# Altium schematic sheet ESP32_Sheet.SchDoc (part 1 of 3)
size 420 x 297 mm; SheetNumber: 3; SheetTotal: 15
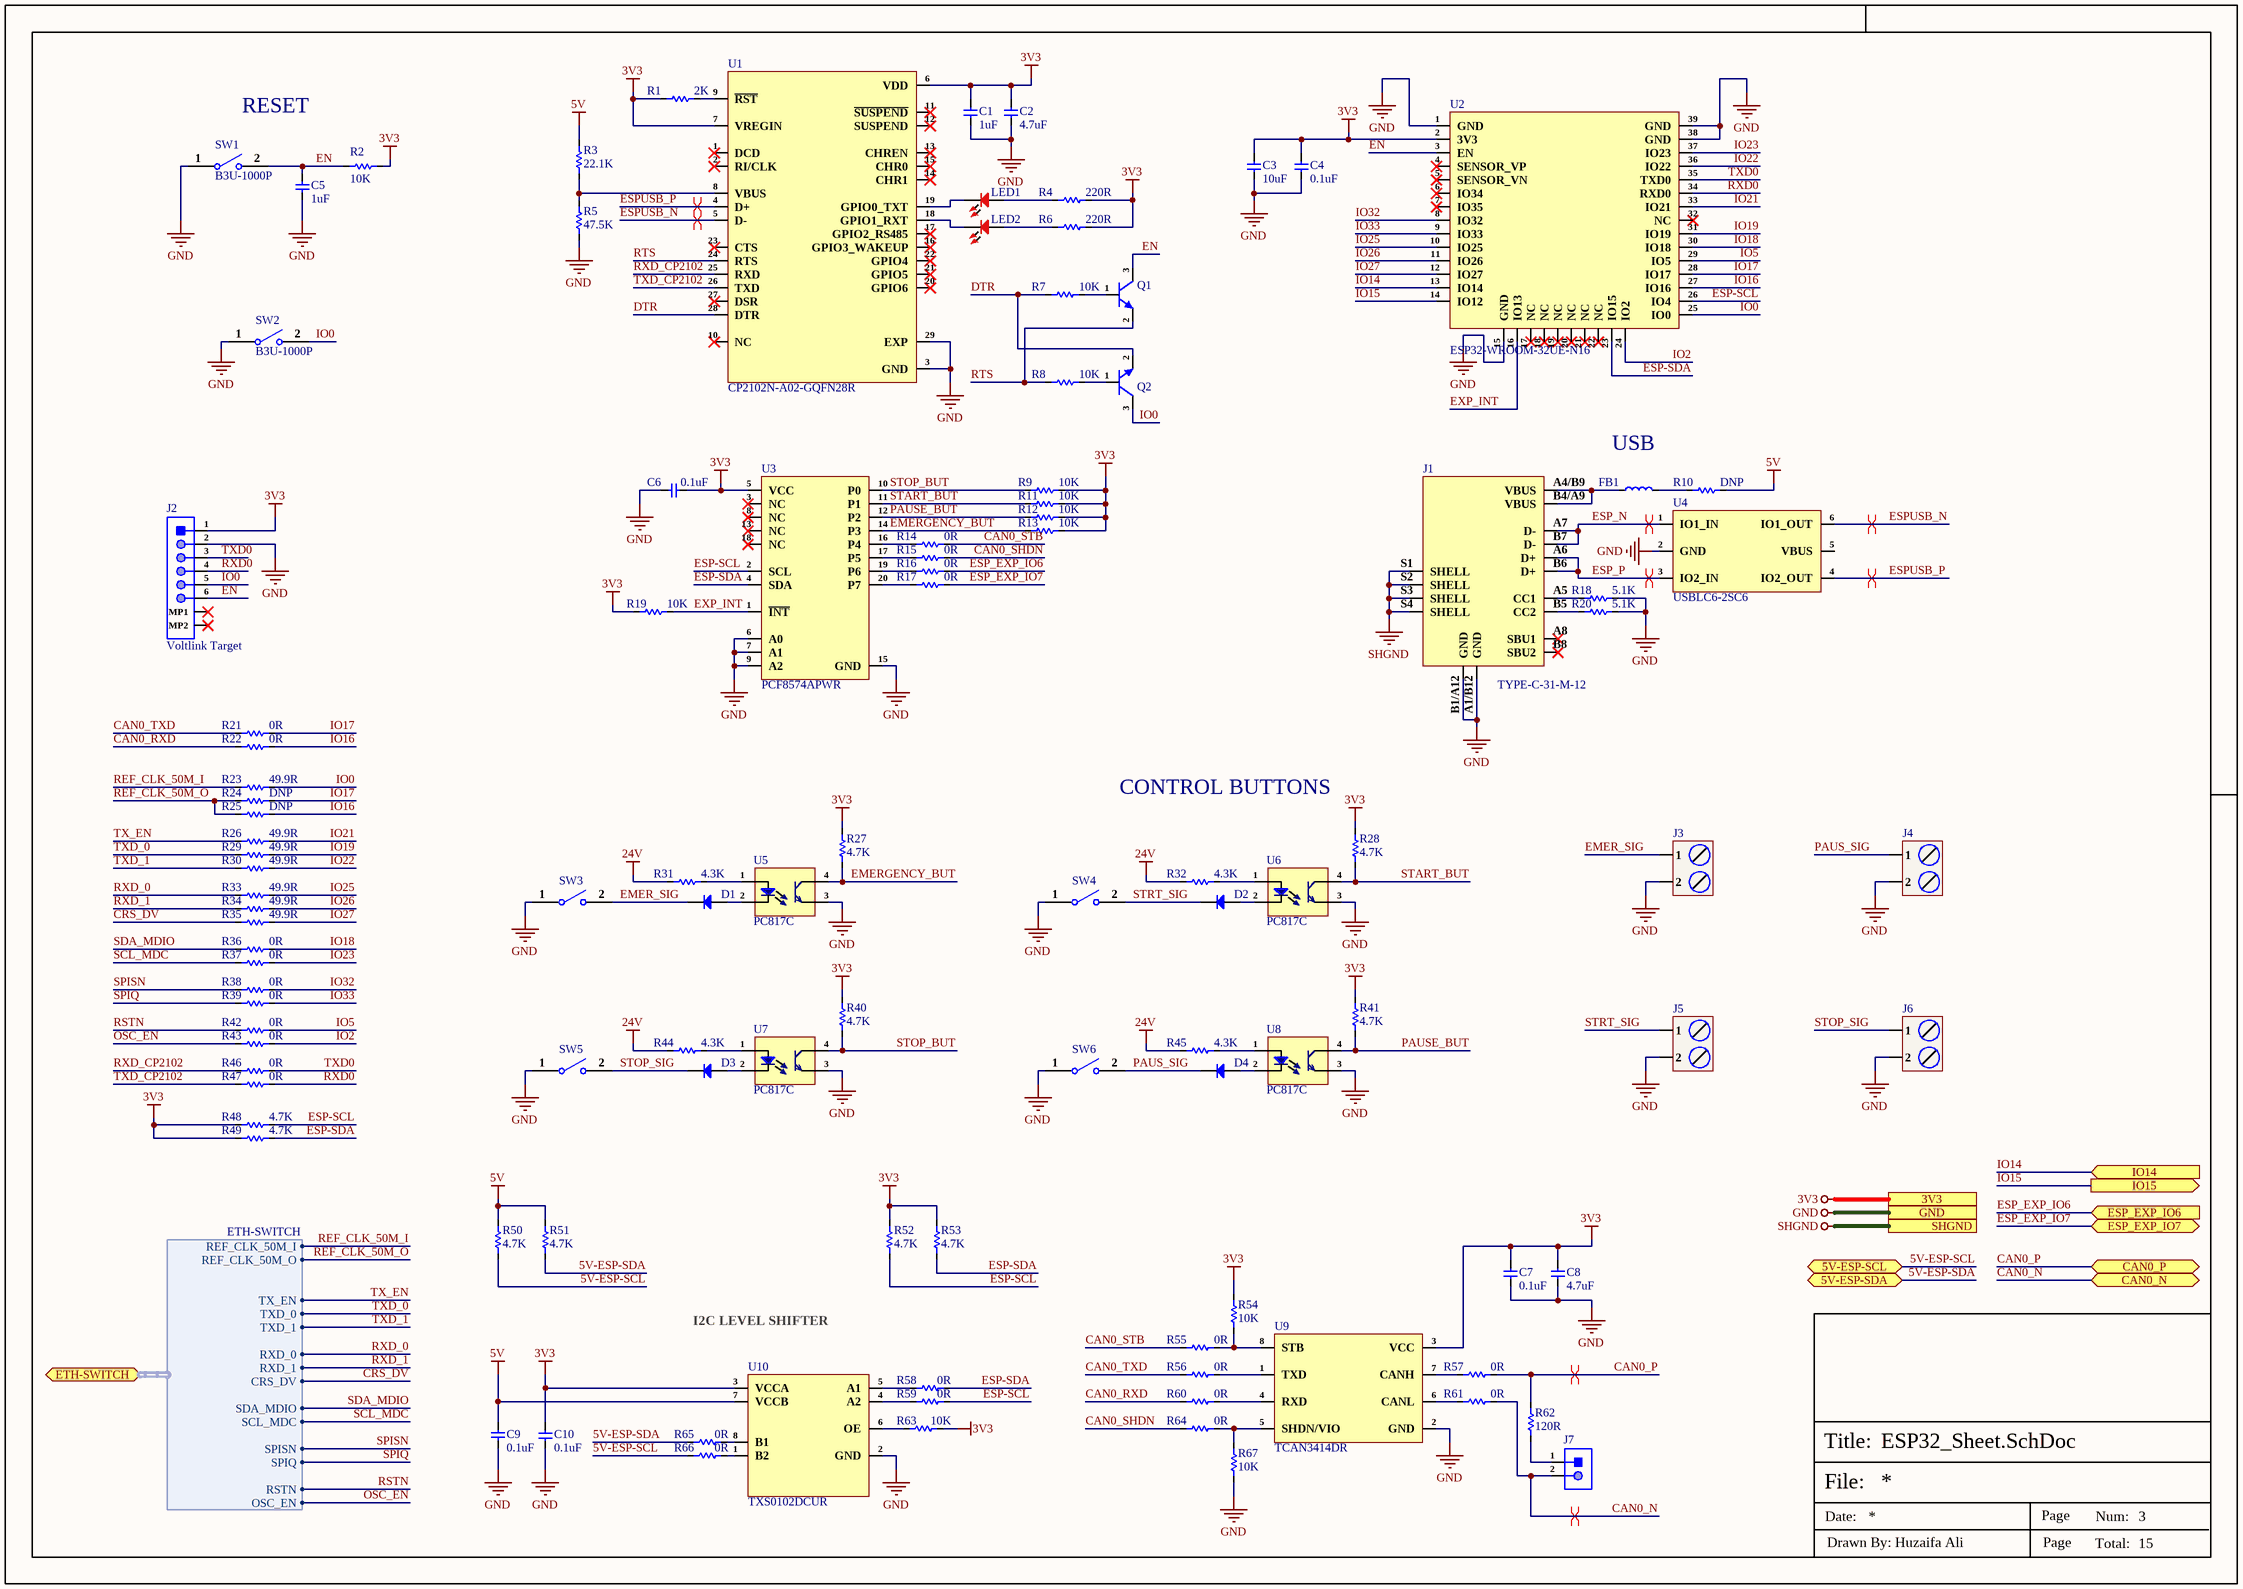
[diagram p0: ESP32_Sheet.SchDoc]

## Parts
C1  1uF  [Cap-0402]
C2  4.7uF  [Cap-0805]
C3  10uF  [Cap-0603]
C4  0.1uF  [Cap-0402]
C5  1uF  [Cap-0402]
C6  0.1uF  [Cap-0402]
C7  0.1uF  [Cap-0402]
C8  4.7uF  [Cap-0402]
C9  0.1uF  [Cap-0402]
C10  0.1uF  [Cap-0402]
D1  1N4148W-7-F  [SOD-123]  (value not drawn)
D2  1N4148W-7-F  [SOD-123]  (value not drawn)
D3  1N4148W-7-F  [SOD-123]  (value not drawn)
D4  1N4148W-7-F  [SOD-123]  (value not drawn)
FB1  BLM18PG221SN1D  [IND-0603 (1608 Metric)]  (value not drawn)
J1  TYPE-C-31-M-12  [TYPE-C-31-M-12_]
J2  Voltlink Target  [Voltlink Target]
J3  DB128L-5.08-2P-OG-S  [DB128L-5.08-2P-OG-S]  (value not drawn)
J4  DB128L-5.08-2P-GY-S  [DB128L-5.08-2P-GY-S]  (value not drawn)
J5  DB128L-5.08-2P-GN-S  [DB128L-5.08-2P-GN-S]  (value not drawn)
J6  DB128L-5.08-2P-BK-S  [DB128L-5.08-2P-BK-S]  (value not drawn)
J7  X6511WV-02H-C60D30  [HDR1X2_]  (value not drawn)
LED1  RED  [LED-0603]  (value not drawn)
LED2  RED  [LED-0603]  (value not drawn)
Q1  SS8050-G  [SOT-23]  (value not drawn)
Q2  SS8050-G  [SOT-23]  (value not drawn)
R1  2K  [Res-0402]
R2  10K  [Res-0402]
R3  22.1K  [Res-0603]
R4  220R  [Res-0603]
R5  47.5K  [Res-0603]
R6  220R  [Res-0603]
R7  10K  [Res-0402]
R8  10K  [Res-0402]
R9  10K  [Res-0402]
R10  DNP  [Res-0402]
R11  10K  [Res-0402]
R12  10K  [Res-0402]
R13  10K  [Res-0402]
R14  0R  [Res-0402]
R15  0R  [Res-0402]
R16  0R  [Res-0402]
R17  0R  [Res-0402]
R18  5.1K  [Res-0402]
R19  10K  [Res-0402]
R20  5.1K  [Res-0402]
R21  0R  [Res-0402]
R22  0R  [Res-0402]
R23  49.9R  [Res-0402]
R24  DNP  [Res-0402]
R25  DNP  [Res-0402]
R26  49.9R  [Res-0402]
R27  4.7K  [Res-0402]
R28  4.7K  [Res-0402]
R29  49.9R  [Res-0402]
R30  49.9R  [Res-0402]
R31  4.3K  [Res-0402]
R32  4.3K  [Res-0402]
R33  49.9R  [Res-0402]
R34  49.9R  [Res-0402]
R35  49.9R  [Res-0402]
R36  0R  [Res-0402]
R37  0R  [Res-0402]
R38  0R  [Res-0402]
R39  0R  [Res-0402]
R40  4.7K  [Res-0402]
R41  4.7K  [Res-0402]
R42  0R  [Res-0402]
R43  0R  [Res-0402]
R44  4.3K  [Res-0402]
R45  4.3K  [Res-0402]
R46  0R  [Res-0402]
R47  0R  [Res-0402]
R48  4.7K  [Res-0402]
R49  4.7K  [Res-0402]
R50  4.7K  [Res-0402]
R51  4.7K  [Res-0402]
R52  4.7K  [Res-0402]
R53  4.7K  [Res-0402]
R54  10K  [Res-0402]
R55  0R  [Res-0402]
R56  0R  [Res-0402]
R57  0R  [Res-0402]
R58  0R  [Res-0402]
R59  0R  [Res-0402]
R60  0R  [Res-0402]
R61  0R  [Res-0402]
R62  120R  [Res-0603]
R63  10K  [Res-0402]
R64  0R  [Res-0402]
R65  0R  [Res-0402]
R66  0R  [Res-0402]
R67  10K  [Res-0402]
SW1  B3U-1000P  [B3U-1000P]
SW2  B3U-1000P  [B3U-1000P]
SW3  B3U-1000P  [B3U-1000P]  (value not drawn)
SW4  B3U-1000P  [B3U-1000P]  (value not drawn)
SW5  B3U-1000P  [B3U-1000P]  (value not drawn)
SW6  B3U-1000P  [B3U-1000P]  (value not drawn)
U1  CP2102N-A02-GQFN28R  [28-QFN (5x5)_]
U2  ESP32-WROOM-32UE-N16  [ESP32-WROOM-32UE-N16]
U3  PCF8574APWR  [TSSOP-20]
U4  USBLC6-2SC6  [SOT-23-6]
U5  PC817C  [PC817C]
U6  PC817C  [PC817C]
U7  PC817C  [PC817C]
U8  PC817C  [PC817C]
U9  TCAN3414DR  [SOIC-8(0.154", 3.90mm Width)]
U10  TXS0102DCUR  [VSSOP-8(3.1x2.1)]

## Ports
3V3 (see Top-Sheet[2B], CAN-Sheet[5D], Controller-Sheet-1[4D], Controller-Sheet-2[4D], Controller-Sheet-3[4D], DIOs-Lights-Sensors-Sheet[4D], Display-Sheet[5D], EtherCAT-Sheet[1D], Ethernet-Sheet[5D], Power-Sheet[4D], RS232-Sheet[5D], RS485-Sheet[5D], STM32-USB-Sheet[4D]), 5V-ESP-SCL (bidir, see Top-Sheet[2B]), 5V-ESP-SDA (bidir, see Top-Sheet[2B]), CAN0_N (bidir, see Top-Sheet[2B]), CAN0_P (bidir, see Top-Sheet[2B]), ESP_EXP_IO6 (in, see Top-Sheet[2B]), ESP_EXP_IO7 (bidir, see Top-Sheet[2B]), ETH-SWITCH (bidir, harness ETH-SWITCH, see Top-Sheet[2B], Ethernet-Sheet[1D]), GND (see Top-Sheet[2B], Analog-AIO-Sheet[5D], CAN-Sheet[6D], Controller-Sheet-1[4D], Controller-Sheet-2[4D], Controller-Sheet-3[4D], DIOs-Lights-Sensors-Sheet[4D], Display-Sheet[5D], EtherCAT-Sheet[1D], Ethernet-Sheet[5D], Power-Sheet[4D], RS232-Sheet[5D], RS485-Sheet[5D], STM32-USB-Sheet[4D]), IO14 (in, see Top-Sheet[2B]), IO15 (out, see Top-Sheet[2B]), SHGND (see Top-Sheet[2B], EtherCAT-Sheet[1D], Power-Sheet[4D], STM32-USB-Sheet[4D])

## Harnesses
ETH-SWITCH: REF_CLK_50M_I, REF_CLK_50M_O, TX_EN, TXD_0, TXD_1, RXD_0, RXD_1, CRS_DV, SDA_MDIO, SCL_MDC, SPISN, SPIQ, RSTN, OSC_EN

## Nets
3V3: C1.2 C2.2 C3.2 C4.2 C6.1 C7.2 C8.2 C10.2 J2.1 R1.1 R2.2 R4.2 R6.2 R9.2 R11.2 R12.2 R13.2 R19.1 R27.2 R28.2 R40.2 R41.2 R48.2 R49.2 R52.2 R53.2 R54.2 R63.2 U1.6(VDD) U1.7(VREGIN) U2.2(3V3) U3.5(VCC) U9.3(VCC) U10.3(VCCA) ; port 3V3
5V: C9.1 R3.1 R10.2 R50.2 R51.2 U10.7(VCCB)
24V: R31.1 R32.1 R44.1 R45.1
GND: C1.1 C2.1 C3.1 C4.1 C5.1 C6.2 C7.1 C8.1 C9.2 C10.1 J1.A1/B12(GND) J1.B1/A12(GND) J2.2 J3.2 J4.2 J5.2 J6.2 R5.1 R18.2 R20.2 R67.1 SW1.1 SW2.1 SW3.1 SW4.1 SW5.1 SW6.1 U1.3(GND) U1.29(EXP) U2.1(GND) U2.15(GND) U2.38(GND) U2.39(GND) U3.6(A0) U3.7(A1) U3.9(A2) U3.15(GND) U4.2(GND) U5.3(E) U6.3(E) U7.3(E) U8.3(E) U9.2(GND) U10.2(GND) ; port GND
SHGND: J1.S1(SHELL) J1.S2(SHELL) J1.S3(SHELL) J1.S4(SHELL) ; port SHGND
5V-ESP-SCL: R50.1 R66.1 ; port 5V-ESP-SCL
5V-ESP-SDA: R51.1 R65.1 ; port 5V-ESP-SDA
CAN0_N: J7.2 R61.2 ; port CAN0_N
CAN0_P: R57.2 R62.2 ; port CAN0_P
CAN0_RXD: R22.2 R60.1
CAN0_SHDN: R15.1 R64.1
CAN0_STB: R14.1 R55.1
CAN0_TXD: R21.2 R56.1
CRS_DV: R35.1 ; port ETH-SWITCH.CRS_DV
DTR: Q2.2(E) R7.1 U1.28(DTR)
EMER_SIG: D1.2(K) J3.1 SW3.2
EMERGENCY_BUT: R13.1 R27.1 U3.14(P3) U5.4(C)
EN: C5.2 J2.6 Q1.3(C) R2.1 SW1.2 U2.3(EN)
ESP-SCL: R48.1 R52.1 R59.2 U2.26(IO4) U3.2(SCL)
ESP-SDA: R49.1 R53.1 R58.2 U2.23(IO15) U3.4(SDA)
ESP_EXP_IO6: R16.1 ; port ESP_EXP_IO6
ESP_EXP_IO7: R17.1 ; port ESP_EXP_IO7
ESP_N: J1.A7(D-) J1.B7(D-) U4.1(IO1_IN)
ESP_P: J1.A6(D+) J1.B6(D+) U4.3(IO2_IN)
ESPUSB_N: U1.5(D-) U4.6(IO1_OUT)
ESPUSB_P: U1.4(D+) U4.4(IO2_OUT)
EXP_INT: R19.2 U2.16(IO13) U3.1(~{INT})
IO0: J2.5 Q2.3(C) R23.2 SW2.2 U2.25(IO0)
IO2: R43.1 U2.24(IO2)
IO5: R42.1 U2.29(IO5)
IO14: U2.13(IO14) ; port IO14
IO15: U2.14(IO12) ; port IO15
IO16: R22.1 R25.2 U2.27(IO16)
IO17: R21.1 R24.2 U2.28(IO17)
IO18: R36.1 U2.30(IO18)
IO19: R29.2 U2.31(IO19)
IO21: R26.2 U2.33(IO21)
IO22: R30.2 U2.36(IO22)
IO23: R37.1 U2.37(IO23)
IO25: R33.2 U2.10(IO25)
IO26: R34.2 U2.11(IO26)
IO27: R35.2 U2.12(IO27)
IO32: R38.1 U2.8(IO32)
IO33: R39.1 U2.9(IO33)
OSC_EN: R43.2 ; port ETH-SWITCH.OSC_EN
PAUS_SIG: D4.2(K) J4.1 SW6.2
PAUSE_BUT: R12.1 R41.1 U3.12(P2) U8.4(C)
REF_CLK_50M_I: R23.1 ; port ETH-SWITCH.REF_CLK_50M_I
REF_CLK_50M_O: R24.1 R25.1 ; port ETH-SWITCH.REF_CLK_50M_O
RSTN: R42.2 ; port ETH-SWITCH.RSTN
RTS: Q1.2(E) R8.1 U1.24(RTS)
RXD0: J2.4 R47.1 U2.34(RXD0)
RXD_0: R33.1 ; port ETH-SWITCH.RXD_0
RXD_1: R34.1 ; port ETH-SWITCH.RXD_1
RXD_CP2102: R46.2 U1.25(RXD)
SCL_MDC: R37.2 ; port ETH-SWITCH.SCL_MDC
SDA_MDIO: R36.2 ; port ETH-SWITCH.SDA_MDIO
SPIQ: R39.2 ; port ETH-SWITCH.SPIQ
SPISN: R38.2 ; port ETH-SWITCH.SPISN
START_BUT: R11.1 R28.1 U3.11(P1) U6.4(C)
STOP_BUT: R9.1 R40.1 U3.10(P0) U7.4(C)
STOP_SIG: D3.2(K) J6.1 SW5.2
STRT_SIG: D2.2(K) J5.1 SW4.2
TX_EN: R26.1 ; port ETH-SWITCH.TX_EN
TXD0: J2.3 R46.1 U2.35(TXD0)
TXD_0: R29.1 ; port ETH-SWITCH.TXD_0
TXD_1: R30.1 ; port ETH-SWITCH.TXD_1
TXD_CP2102: R47.2 U1.26(TXD)
NetD1_1: D1.1(A) U5.2(Ca)
NetD2_1: D2.1(A) U6.2(Ca)
NetD3_1: D3.1(A) U7.2(Ca)
NetD4_1: D4.1(A) U8.2(Ca)
NetFB1_1: FB1.1 J1.A4/B9(VBUS) J1.B4/A9(VBUS)
NetFB1_2: FB1.2 R10.1
NetJ1_A5: J1.A5(CC1) R18.1
NetJ1_B5: J1.B5(CC2) R20.1
NetJ7_1: J7.1 R62.1
NetLED1_1: LED1.1 R4.1
NetLED1_2: LED1.2 U1.19(GPIO0_TXT)
NetLED2_1: LED2.1 R6.1
NetLED2_2: LED2.2 U1.18(GPIO1_RXT)
NetQ1_1: Q1.1(B) R7.2
NetQ2_1: Q2.1(B) R8.2
NetR1_2: R1.2 U1.9(~{RST})
NetR3_2: R3.2 R5.2 U1.8(VBUS)
NetR14_2: R14.2 U3.16(P4)
NetR15_2: R15.2 U3.17(P5)
NetR16_2: R16.2 U3.19(P6)
NetR17_2: R17.2 U3.20(P7)
NetR31_2: R31.2 U5.1(An)
NetR32_2: R32.2 U6.1(An)
NetR44_2: R44.2 U7.1(An)
NetR45_2: R45.2 U8.1(An)
NetR54_1: R54.1 R55.2 U9.8(STB)
NetR56_2: R56.2 U9.1(TXD)
NetR57_1: R57.1 U9.7(CANH)
NetR58_1: R58.1 U10.5(A1)
NetR59_1: R59.1 U10.4(A2)
NetR60_2: R60.2 U9.4(RXD)
NetR61_1: R61.1 U9.6(CANL)
NetR63_1: R63.1 U10.6(OE)
NetR64_2: R64.2 R67.2 U9.5(SHDN/VIO)
NetR65_2: R65.2 U10.8(B1)
NetR66_2: R66.2 U10.1(B2)

Not connected (* = marked no-connect by the designer): J1 A8(SBU1)* B8(SBU2)*; J2 MP1* MP2*; U1 1(DCD)* 2(RI/CLK)* 10(NC)* 11(~{SUSPEND})* 12(SUSPEND)* 13(CHREN)* 14(CHR1)* 15(CHR0)* 16(GPIO3_WAKEUP)* 17(GPIO2_RS485)* 20(GPIO6)* 21(GPIO5)* 22(GPIO4)* 23(CTS)* 27(DSR)*; U2 4(SENSOR_VP)* 5(SENSOR_VN)* 6(IO34)* 7(IO35)* 17(NC)* 18(NC)* 19(NC)* 20(NC)* 21(NC)* 22(NC)* 32(NC)*; U3 3(NC)* 8(NC)* 13(NC)* 18(NC)*; U4 5(VBUS)

## Layout directives
differential pair; net class USB_PROGRAM; differential pair class USB_PROGRAM_LINES; rule Impedance Constraint [Min = 85.00    Max = 90.00    ]; rule Matched Net Lengths [Tolerance = 50mil]: ESP_N, ESP_P, ESPUSB_N, ESPUSB_P
differential pair; net class USB; differential pair class USB_Lines; rule Impedance Constraint [Min = 85.00    Max = 90.00    ]; rule Matched Net Lengths [Tolerance = 50mil]: ESPUSB_N, ESPUSB_P
differential pair; differential pair class CAN: CAN0_N, CAN0_P

## Notes on the sheet
- RESET
- (near FB1) USB
- CONTROL BUTTONS
- I2C LEVEL SHIFTER
- File:
- Title:
- Date:
- Page
- Num:
- Total:
- Drawn By: Huzaifa Ali